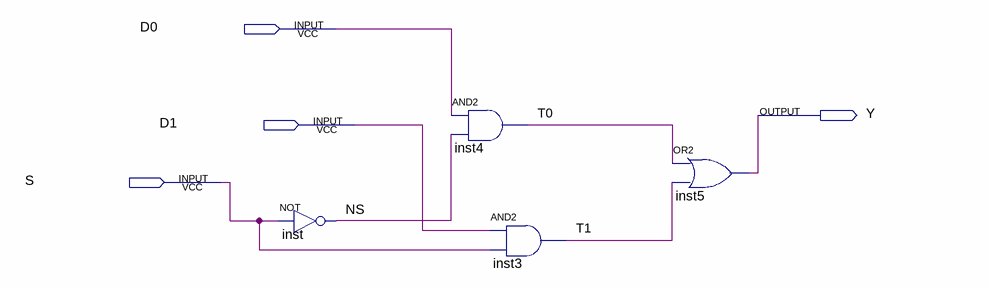
[diagram p0: schematic sheet]
// Quartus schematic select_one_from_two_hxgdly.bdf as structural Verilog: 4 symbols, 4 pins
module select_one_from_two_hxgdly (
  input  D0,
  input  D1,
  input  S,
  output Y
);

  wire NS, T0, T1;

  not inst (NS, S);
  and inst4 (T0, D0, NS);
  and inst3 (T1, D1, S);
  or inst5 (Y, T0, T1);
endmodule
